# Altium schematic sheet POWER_CONNECTOR.SchDoc
size A4; SheetNumber: 10; SheetTotal: 11
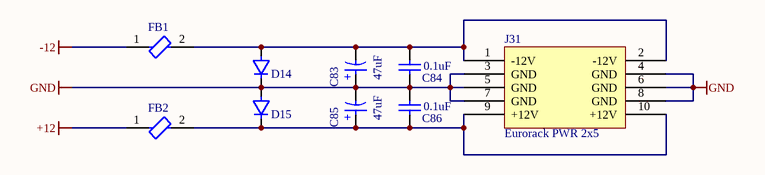
[diagram p0: POWER_CONNECTOR.SchDoc]

## Parts
C83  47uF  [WCAP-ASLI_D4H5.5]
C84  0.1uF  [CAPC2013X145X48NL20T23]
C85  47uF  [WCAP-ASLI_D4H5.5]
C86  0.1uF  [CAPC2013X145X48NL20T23]
D14  1N4148WS  [4148]  (value not drawn)
D15  1N4148WS  [4148]  (value not drawn)
FB1  BLM21PG600BH1D  [0805-hs]  (value not drawn)
FB2  BLM21PG600BH1D  [0805-hs]  (value not drawn)
J31  Eurorack PWR 2x5  [EURORACK_PWR_2x5_P2.54_SHROUDED]

## Nets
+12: FB2.1
-12: FB1.1
GND: C83.1(P) C84.1 C85.2(N) C86.2 D14.1(C) D15.2(A) J31.3(GND) J31.4(GND) J31.5(GND) J31.6(GND) J31.7(GND) J31.8(GND)
NetC83_2: C83.2(N) C84.2 D14.2(A) FB1.2 J31.1(-12V) J31.2(-12V)
NetC85_1: C85.1(P) C86.1 D15.1(C) FB2.2 J31.9(+12V) J31.10(+12V)

## Notes on the sheet
- (in symbol Cap_polarized) +

## Library data of the parts
C83 C85 = Cap_polarized: WCAP-ASLI Aluminum Electrolytic Capacitors; Ripple Current: 80mA; Voltage Rating (DC): 16V; Impedance: 2.2Ω; Tolerance: 20%; ESR (Equivalent Series Resistance): 1.66693Ω; Polarity: Polar; Leakage Current: 3µA; Capacitance: 10µF; Life (Hours): 2000hours; Insulation Resistance: 5.33333MΩ; Mount: Surface Mount; RoHS: Compliant; Ripple Current (AC): 80mA; REACH SVHC: Unknown; Lead Free: Lead Free; Max Operating Temperature: 105°C; Case/Package: Radial; Diameter: 4mm; Min Operating Temperature: -55°C; Length: 5.5mm; Width: 4.3mm; Height - Seated (Max): 5.5118mm; Voltage Rating: 16V; Height: 5.5mm
C84 C86 = CAP: Manufacturer: Vitramon; Part Number: VJ0805Y682KXAMT
D14 D15 = 4148WS: DIODE GEN PURP 75V 150MA SOD323F; Forward Voltage: 1V; Power Dissipation: 200mW; Element Configuration: Single; Max Forward Surge Current (Ifsm): 2A; Peak Reverse Current: 5uA; Recovery Time: 4ns; Package Quantity: 1; Number of Pins: 2; Height: 1mm; REACH SVHC: No SVHC; Max Reverse Voltage (DC): 75V; Forward Current: 150mA; Length: 1.8mm; Max Repetitive Reverse Voltage (Vrrm): 75V; Max Operating Temperature: 150°C; Average Rectified Current: 150mA; Contact Plating: Tin; Packaging: Tape and Reel; Radiation Hardening: No; Min Operating Temperature: -55°C; Width: 1.35mm; Weight: 0.0276g; Lead Free: Lead Free; Mount: Surface Mount; Reverse Voltage: 75V; Reverse Recovery Time: 4ns
FB1 FB2 = Ferrite: Chip Ferrite Bead, 0805, 60Ω @ 100MHz, 0.02Ω, 25%, 1.9A; RoHS Compliant: No
J31 = EURORACK_PWR_2x5: Eurorack power header 2x5 shrouded. Pin 1-2 -12V (red stripe), 3-8 GND, 9-10 +12V